# Altium project K_Cepelis_EKf-24.PrjPcb (part 6 of 6)
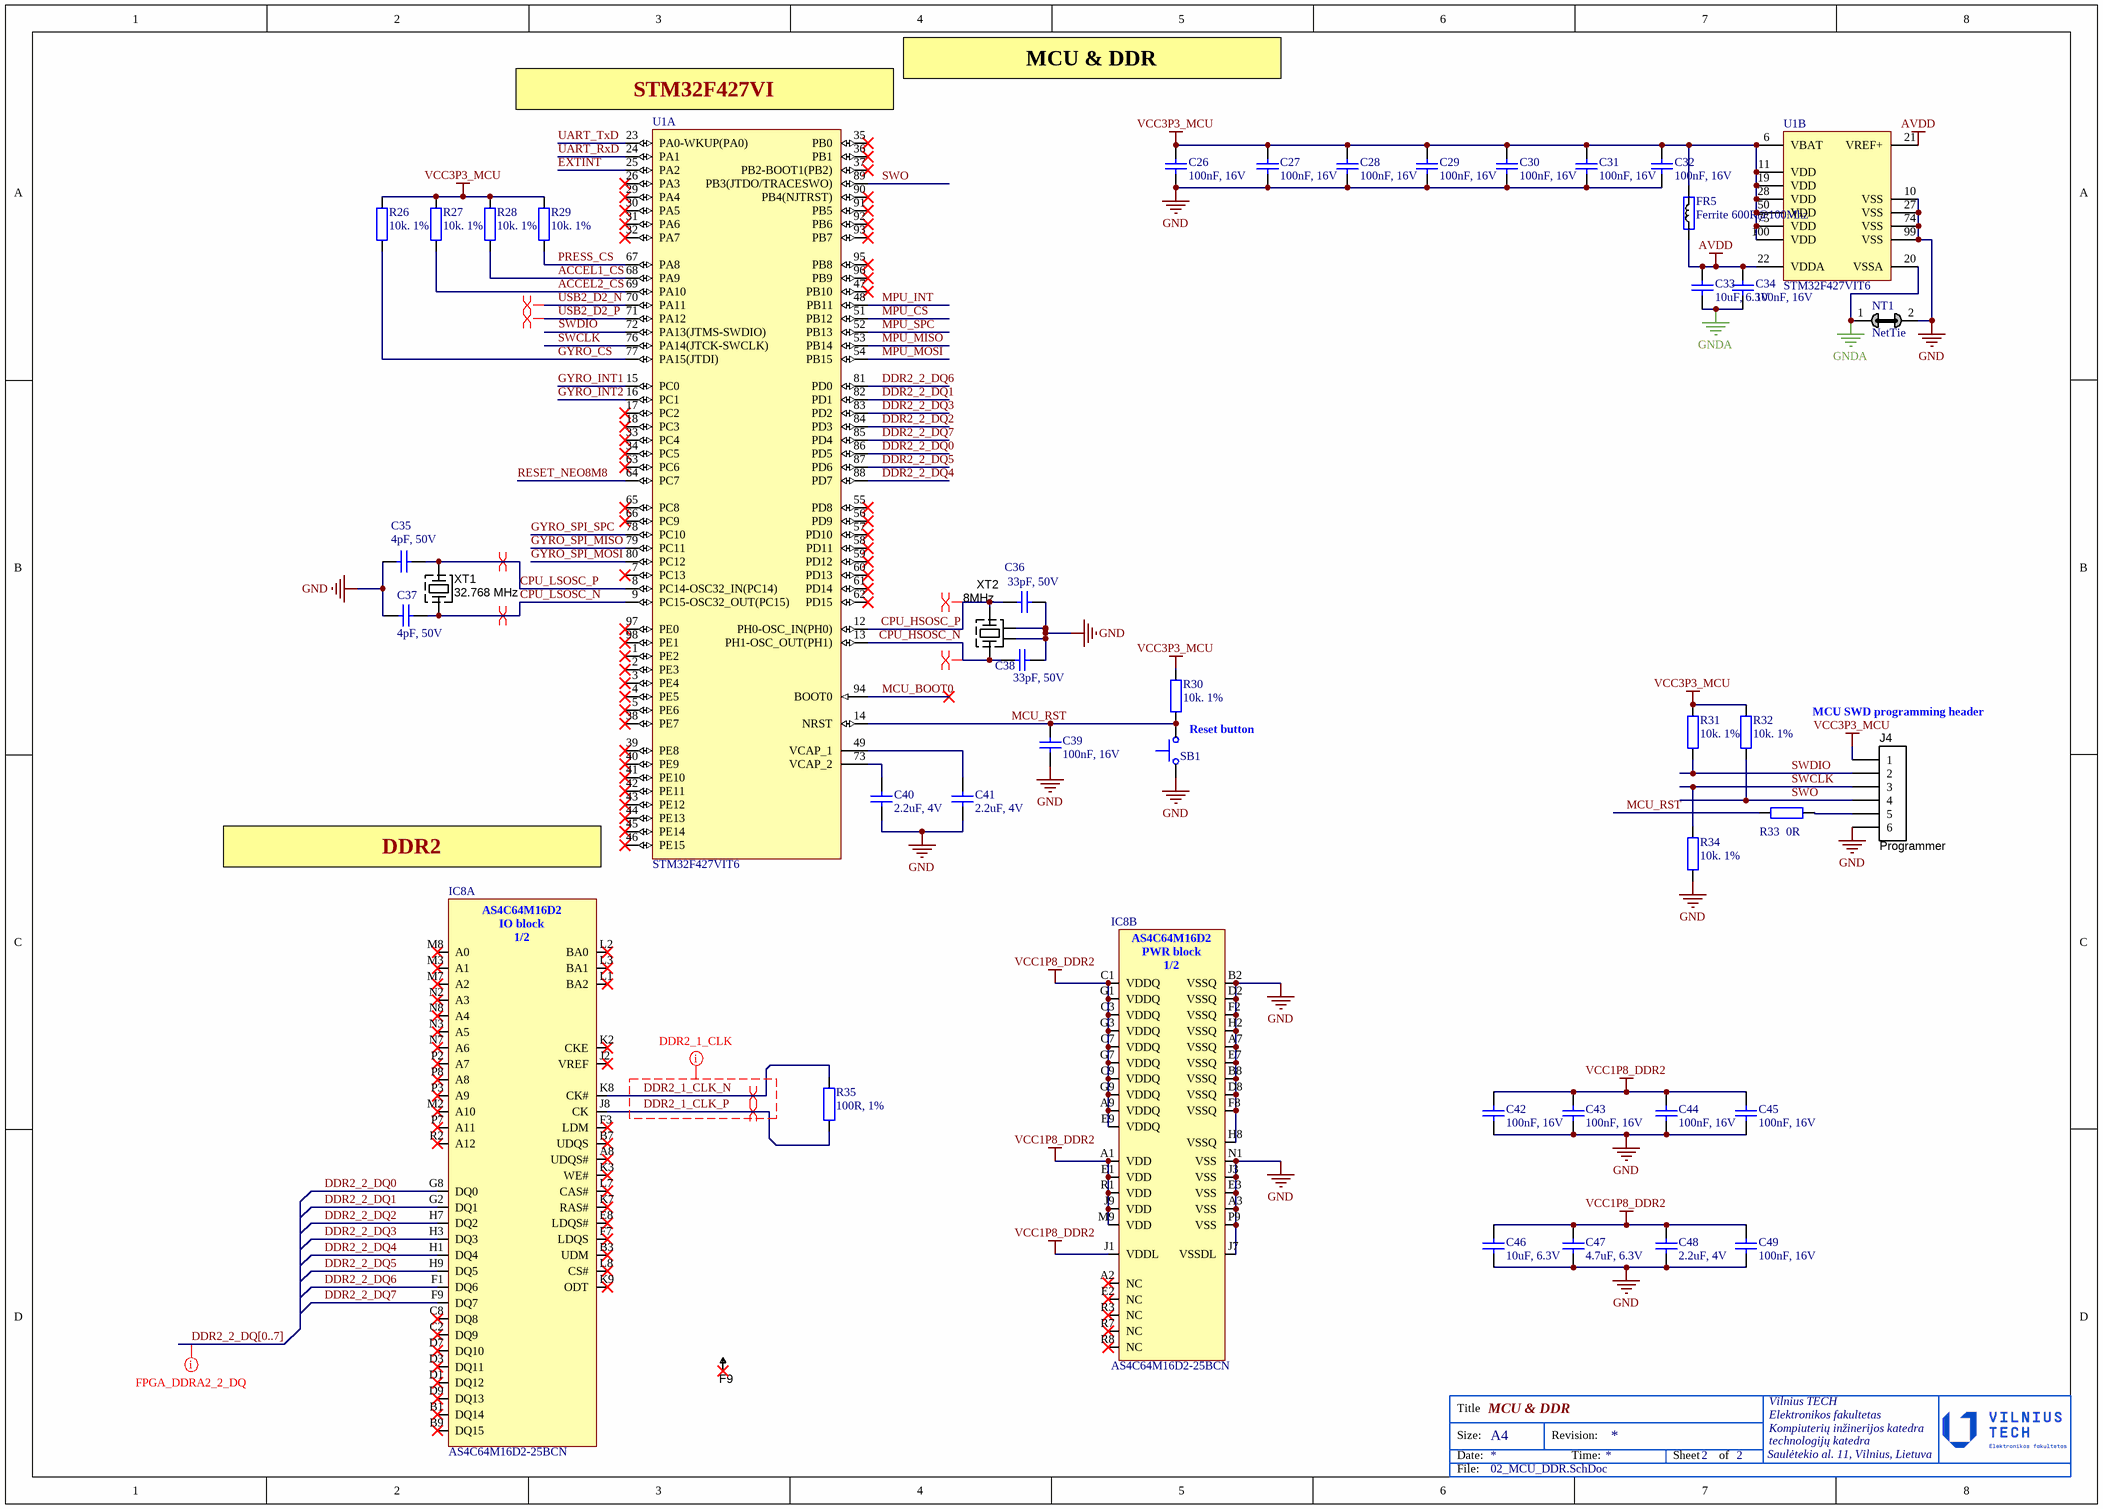
[diagram p6: 02_MCU_DDR.SchDoc]

## Sheet 02_MCU_DDR.SchDoc: MCU & DDR (continued)

### Library data of the parts (continued)
R35 = Res: Res Thick Film 0402 100 Ohm 1% 0.063W(1/16W) ±100ppm/C Pad SMD Automotive T/R; Manufacturer: Stackpole Electronics; Manufacturer Part Number: RMCF0402FT100R; Max Power Dissipation: 63mW; Temperature Coefficient: 100ppm/°C; Voltage Rating: 50V; Value: 100R, 1%; Supplier: Arrow Electronics; Supplier Part Number: RMCF0402FT100R; RoHS: Compliant; Category: Chip SMD Resistors; Stock: 280000; Pricing: 60000=0.0016 (USD); Case/Package: 0402; Case Code (Imperial): 0402; Case Code (Metric): 1005; China RoHS: Non-Compliant; Composition: Thick Film; Contact Plating: Tin; Country of Origin: Japan, Mainland China, Taiwan; Depth: 500µm; Export Control Classification Number (ECCN) Code: EAR99; Features: Automotive AEC-Q200; Height: 300µm; Harmonized Tariff Schedule (HTS) Code: 8533.21.00.30; Introduction Date: 2011-01-07; Lead Free: Lead Free; Length: 1mm; Lifecycle Status: Production; Max Operating Temperature: 155°C; Military Standard: Not; Min Operating Temperature: -55°C; Mounting Technology: Surface Mount; Number of Terminals: 2; Number of Terminations: 2; Packaging: Cut Tape (CT); Power Rating: 63mW; Ratings: AEC-Q200; REACH SVHC: Yes; Schedule B: 8533210045, 8533210045|8533210045, 8533210045|8533210045|8533210045, 8533210045|8533210045|8533210045|8533210045; Tolerance: 1%; Width: 500µm; Working Voltage: 50V; ComponentLink1URL: https://datasheet.octopart.com:443/RMCF0402FT100R-Stackpole-Electronics-datasheet-182148065.pdf?src-supplier=IHS; ComponentLink1Description: https://datasheet.octopart.com:443/RMCF0402FT100R-Stackpole-Electronics-datasheet-182148065.pdf?src-supplier=IHS; ComponentLink2URL: https://datasheet.octopart.com:443/RMCF0402FT100R-Stackpole-Electronics-datasheet-141193804.pdf?src-supplier=Upverter; ComponentLink2Description: https://datasheet.octopart.com:443/RMCF0402FT100R-Stackpole-Electronics-datasheet-141193804.pdf?src-supplier=Upverter; ComponentLink3URL: https://datasheet.octopart.com:443/RMCF0402FT100R-Stackpole-Electronics-datasheet-62091608.pdf?src-supplier=Upverter; ComponentLink3Description: https://datasheet.octopart.com:443/RMCF0402FT100R-Stackpole-Electronics-datasheet-62091608.pdf?src-supplier=Upverter; ComponentLink4URL: https://datasheet.octopart.com:443/RMCF0402FT100R-Stackpole-Electronics-datasheet-28504820.pdf?src-supplier=Upverter; ComponentLink4Description: https://datasheet.octopart.com:443/RMCF0402FT100R-Stackpole-Electronics-datasheet-28504820.pdf?src-supplier=Upverter; ComponentLink5URL: https://datasheet.octopart.com:443/RMCF0402FT100R-Stackpole-Electronics-datasheet-12534581.pdf?src-supplier=Stackpole+Electronics; ComponentLink5Description: https://datasheet.octopart.com:443/RMCF0402FT100R-Stackpole-Electronics-datasheet-12534581.pdf?src-supplier=Stackpole+Electronics; ComponentLink6URL: https://datasheet.octopart.com:443/RMCF0402FT100R-Stackpole-Electronics-datasheet-10788263.pdf?src-supplier=Stackpole+Electronics; ComponentLink6Description: https://datasheet.octopart.com:443/RMCF0402FT100R-Stackpole-Electronics-datasheet-10788263.pdf?src-supplier=Stackpole+Electronics; ComponentLink7URL: https://datasheet.octopart.com:443/RMCF0402FT100R-Stackpole-Electronics-datasheet-155966809.pdf?src-supplier=Electro+Sonic; ComponentLink7Description: https://datasheet.octopart.com:443/RMCF0402FT100R-Stackpole-Electronics-datasheet-155966809.pdf?src-supplier=Electro+Sonic; ComponentLink8URL: https://datasheet.octopart.com:443/RMCF0402FT100R-Stackpole-Electronics-datasheet-189104164.pdf?src-supplier=Master+Electronics; ComponentLink8Description: https://datasheet.octopart.com:443/RMCF0402FT100R-Stackpole-Electronics-datasheet-189104164.pdf?src-supplier=Master+Electronics; ComponentLink9URL: https://datasheet.octopart.com:443/RMCF0402FT100R-Stackpole-Electronics-datasheet-154799224.pdf?src-supplier=Master+Electronics; ComponentLink9Description: https://datasheet.octopart.com:443/RMCF0402FT100R-Stackpole-Electronics-datasheet-154799224.pdf?src-supplier=Master+Electronics; ComponentLink10URL: https://datasheet.octopart.com:443/RMCF0402FT100R-Stackpole-Electronics-datasheet-11547379.pdf?src-supplier=Arrow+Electronics; ComponentLink10Description: https://datasheet.octopart.com:443/RMCF0402FT100R-Stackpole-Electronics-datasheet-11547379.pdf?src-supplier=Arrow+Electronics; ComponentLink11URL: http://sigma.octopart.com:80/15940719/materials_sheet/Stackpole-Electronics-RMCF0402FT100R.pdf?src-supplier=Compliance+Statements; ComponentLink11Description: http://sigma.octopart.com:80/15940719/materials_sheet/Stackpole-Electronics-RMCF0402FT100R.pdf?src-supplier=Compliance+Statements; ComponentLink12URL: http://sigma.octopart.com:80/141158212/rohs_statement/Stackpole-Electronics-RMCF0402FT100R.pdf?src-supplier=Compliance+Statements; ComponentLink12Description: http://sigma.octopart.com:80/141158212/rohs_statement/Stackpole-Electronics-RMCF0402FT100R.pdf?src-supplier=Compliance+Statements; ComponentLink13URL: http://sigma.octopart.com:80/141158211/reach_statement/Stackpole-Electronics-RMCF0402FT100R.pdf?src-supplier=Compliance+Statements; ComponentLink13Description: http://sigma.octopart.com:80/141158211/reach_statement/Stackpole-Electronics-RMCF0402FT100R.pdf?src-supplier=Compliance+Statements
SB1 = Button: Switch Tactile N.O. SPST Round Button Solder Tab 12VDC 200000Cycles 1.5N SMD Emboss T/R; Manufacturer: Omron; Manufacturer Part Number: B3U-1000P; Manufacturer Package Identifier: B3U-1000P(M); Actuator Length: 400µm; Contact Current Rating: 50mA; Contact Resistance: 100mΩ; Electrical Life: 200kcycles; Illumination Type: Illuminated, Non-Illuminated; Max Voltage Rating (DC): 12V; Number of Positions: 1; Operating Force: 1.99N; Ratings: Dust Proof, IP40; Sealable: DUST PROOF; Switch Function: Off-Mom; Switch Travel: 150µm; Supplier: DigiKey; Supplier Part Number: SW1020CT-ND; RoHS: Compliant; Category: Tactile Switches; Stock: 119444; Pricing: 1=1.17, 10=0.997, 25=0.9268, 100=0.8261, 250=0.76544, 500=0.72342, 1000=0.68504 (USD); Ambient Temperature Range High: 70°C; Color: Silver; Contact Material: Silver; Contact Plating: Silver; Current Rating: 50mA; Depth: 2.5mm; Height: 1.2mm; Insulation Resistance: 100MΩ; Lead Free: Lead Free; Length: 3mm; Life (Cycles): 200kcycles; Lifecycle Status: Production; Max Current Rating: 50mA; Max Operating Temperature: 70°C; Mechanical Life: 200kcycles; Min Operating Temperature: -25°C; Mounting Technology: Surface Mount; Pins: 2; Packaging: Tape and Reel; REACH SVHC: Yes; Termination: SMD/SMT; Throw Configuration: SPST; Voltage Rating (DC): 12V; Weight: 21.99923mg; Width: 2.5mm; ComponentLink1URL: https://datasheet.octopart.com:443/B3U-1000P-Omron-datasheet-62106914.pdf?src-supplier=IHS; ComponentLink1Description: https://datasheet.octopart.com:443/B3U-1000P-Omron-datasheet-62106914.pdf?src-supplier=IHS; ComponentLink2URL: https://datasheet.octopart.com:443/B3U-1000P-Omron-datasheet-10910421.pdf?src-supplier=RS+(Formerly+Allied+Electronics); ComponentLink2Description: https://datasheet.octopart.com:443/B3U-1000P-Omron-datasheet-10910421.pdf?src-supplier=RS+(Formerly+Allied+Electronics); ComponentLink3URL: https://datasheet.octopart.com:443/B3U-1000P-Omron-datasheet-5458533.pdf?src-supplier=Upverter; ComponentLink3Description: https://datasheet.octopart.com:443/B3U-1000P-Omron-datasheet-5458533.pdf?src-supplier=Upverter; ComponentLink4URL: https://datasheet.octopart.com:443/B3U-1000P-Omron-datasheet-11968313.pdf?src-supplier=SOS+electronic; ComponentLink4Description: https://datasheet.octopart.com:443/B3U-1000P-Omron-datasheet-11968313.pdf?src-supplier=SOS+electronic; ComponentLink5URL: https://datasheet.octopart.com:443/B3U-1000P-Omron-datasheet-110759174.pdf?src-supplier=Newark; ComponentLink5Description: https://datasheet.octopart.com:443/B3U-1000P-Omron-datasheet-110759174.pdf?src-supplier=Newark; ComponentLink6URL: https://datasheet.octopart.com:443/B3U-1000P-Omron-datasheet-506776.pdf?src-supplier=Newark; ComponentLink6Description: https://datasheet.octopart.com:443/B3U-1000P-Omron-datasheet-506776.pdf?src-supplier=Newark; ComponentLink7URL: https://datasheet.octopart.com:443/B3U-1000P-Omron-datasheet-17589256.pdf?src-supplier=TME; ComponentLink7Description: https://datasheet.octopart.com:443/B3U-1000P-Omron-datasheet-17589256.pdf?src-supplier=TME
U1 = STM32F427VIT6: ARM Cortex-M4 32-bit MCU+FPU, 210 DMIPS, 2048 kB Flash, 256 kB Internal RAM, 82 I/Os, 100-pin LQFP, -40 to 85 degC, Tray; Manufacturer: STMicroelectronics; D/A Converter: 2x12-bit; FLASH Size (Prog) (kB): 2048; I/Os (High Current): 82; Internal RAM Size (kB): 256; Operating Frequency(F) (Processor speed) (MHz): 168; Supply Voltage(Vcc) max (V): 3.6; Supply Voltage(Vcc) min (V): 1.8; DatasheetVersion: Rev. 1; PackageVersion: Rev. 1, 06/2013; PackageReference: LQFP100; PackageDescription: 100-Pin Low Profile Quad Flat Package, 14 x 14 mm Body, 0.5 mm Pitch; Supplier 1: Digi-Key; Supplier Part Number 1: 497-14049-ND; Supplier 2: Farnell; Supplier Part Number 2: 2333369; Supplier 3: Newark; Supplier Part Number 3: 99W9927; Supplier 4: Newark; Supplier Part Number 4: 66W7312; Supplier 5: Mouser; Supplier Part Number 5: 511-STM32F427VIT6; Core: ARM Cortex-M4; Packing: Tray; Mounting Technology: Surface Mount; PartNumber: STM32F427VIT6; ComponentLink1Description: Manufacturer URL; ComponentLink1URL: http://www.st.com/web/en/home.html; ComponentLink2Description: Datasheet; ComponentLink2URL: http://www.st.com/st-web-ui/static/active/en/resource/technical/document/datasheet/DM00071990.pdf; ComponentLink3Description: Package Specification; ComponentLink3URL: http://www.st.com/st-web-ui/static/active/en/resource/technical/document/data_brief/DM00071938.pdf
XT1 = CRYSTAL_v2: Crystal, 32.768Khz, 6Pf, 3.2Mm X 1.5Mm Rohs Compliant: Yes |Abracon ABS07-LR-32.768KHZ-6-T; Manufacturer: Abracon LLC; Operating Mode: Fundamental; ESR (Equivalent Series Resistance): 50 kOhm; Frequency Tolerance: ±20ppm; ESR: 50kΩ; Tolerance: 0.002%; Supplier 1: Digi-Key; Category: Crystals and Oscillators; Mounting Type: Surface Mount; Operating Temperature: -40°C ~ 85°C; Manufacturer Part Number 1: ABS07-LR-32.768KHZ-6-T; Load Capacitance: 6pF; Frequency Stability: -; Type: kHz Crystal (Tuning Fork); Size / Dimension: 0.126" L x 0.061" W (3.20mm x 1.50mm); Package / Case: 2-SMD; RoHS: RoHS Compliant; Ratings: -; Frequency: 32.768kHz; Height: 0.035" (0.90mm); Packaging: Cut Tape (CT); Supplier Part Number 1: 535-12942-1-ND; Supplier: DigiKey; Supplier Part Number: 535-12942-1-ND; Manufacturer Part Number: ABS07-LR-32.768KHZ-6-T; Stock: 176427; Pricing: 1=1.5, 10=1.303, 25=1.232, 50=1.1812, 100=1.1322, 250=1.07076, 500=1.02648, 1000=0.98405 (USD); Case/Package: SMD/SMT; China RoHS: Compliant; Harmonized Tariff Schedule (HTS) Code: 8541.60.00.10; Introduction Date: 2015-04-02; Length: 3.2004mm; Lifecycle Status: Production; Max Operating Temperature: 85°C; Min Operating Temperature: -40°C; Mounting Technology: Surface Mount; REACH SVHC: Yes; Schedule B: 8541600025, 8541600025|8541600025|8541600025|8541600025|8541600025, 8541600080; Width: 1.5494mm; ComponentLink1URL: https://datasheet.octopart.com:443/ABS07-LR-32.768KHZ-6-T-Abracon-datasheet-182205061.pdf?src-supplier=Master+Electronics; ComponentLink1Description: https://datasheet.octopart.com:443/ABS07-LR-32.768KHZ-6-T-Abracon-datasheet-182205061.pdf?src-supplier=Master+Electronics; ComponentLink2URL: https://datasheet.octopart.com:443/ABS07-LR-32.768KHZ-6-T-Abracon-datasheet-65748761.pdf?src-supplier=element14+APAC; ComponentLink2Description: https://datasheet.octopart.com:443/ABS07-LR-32.768KHZ-6-T-Abracon-datasheet-65748761.pdf?src-supplier=element14+APAC; ComponentLink3URL: https://datasheet.octopart.com:443/ABS07-LR-32.768KHZ-6-T-Abracon-datasheet-103422647.pdf?src-supplier=Future+Electronics; ComponentLink3Description: https://datasheet.octopart.com:443/ABS07-LR-32.768KHZ-6-T-Abracon-datasheet-103422647.pdf?src-supplier=Future+Electronics; ComponentLink4URL: http://sigma.octopart.com:80/conflict_mineral_statement/Abracon-company-27.pdf?src-supplier=Compliance+Statements; ComponentLink4Description: http://sigma.octopart.com:80/conflict_mineral_statement/Abracon-company-27.pdf?src-supplier=Compliance+Statements
XT2 = CRYSTAL_19M2: Seam Seal Crystal Ceramic, 8.000Mhz, 18Pf, 20Ppm-20+70C, 50Ppm-20+70C Rohs Compliant: Yes; Manufacturer 1: TXC CORPORATION; Manufacturer Part Number 1: 7M-27.120MEEQ-T; Manufacturer: Abracon; Manufacturer Part Number: ABM3B-8.000MHZ-B2-T; Ratings: 4.9152 MHz Crystal; Frequency Stability: ±10ppm; Load Capacitance: 10pF; Operating Mode: Fundamental; ESR (Equivalent Series Resistance): 200Ω; Max Supply Voltage: 45V; Min Supply Voltage: 8.2V; Output Current: 1.8A; Output Voltage: 3.3V; Tolerance: 0.002%; Package / Case: 2.5mm pitch; Material: Ceramic; Supplier 1: Digi-Key; Supplier Part Number 1: 887-1329-1-ND; Type: MHz Crystal; Frequency Tolerance: ±10ppm; Operating Temperature: -20°C ~ 70°C; Mounting Type: Surface Mount; Size / Dimension: 0.126" L x 0.098" W (3.20mm x 2.50mm); ComponentLink1URL: http://www.txccrystal.com/images/pdf/7m-accuracy.pdf; ComponentLink1Description: http://www.txccrystal.com/images/pdf/7m-accuracy.pdf; Supplier: Arrow Electronics; Supplier Part Number: ABM3B-8.000MHZ-B2-T; RoHS: Compliant; Category: Crystals; Stock: 70000; Pricing: 1000=0.2318 (USD); Case/Package: CSMD; China RoHS: Compliant; Composition: Ceramic; Depth: 3.2mm; Frequency: 8MHz; Height: 1.1mm; Lead Free: Lead Free; Length: 5mm; Lifecycle Status: Production; Max Operating Temperature: 70°C; Min Operating Temperature: -20°C; Mounting Technology: Surface Mount; Pins: 4; Packaging: Rail/Tube; Radiation Hardening: No; REACH SVHC: Yes; Schedule B: 8541600025, 8541600025|8541600025|8541600025|8541600025|8541600025|8541600025|8541600025|8541600025|8541600025|8541600025|8541600025|8541600025|8541600025|8541600025|8541600025|8541600025|8541600025|8541600025|8541600025|8541600025|8541600025|8541600025|8541600025|85; ESR: 200Ω; Termination: SMD/SMT; Weight: 120.003531mg; Width: 3.2mm; ComponentLink2URL: https://datasheet.octopart.com:443/ABM3B-8.000MHZ-B2-T-Abracon-datasheet-103053453.pdf?src-supplier=IHS; ComponentLink2Description: https://datasheet.octopart.com:443/ABM3B-8.000MHZ-B2-T-Abracon-datasheet-103053453.pdf?src-supplier=IHS; ComponentLink3URL: https://datasheet.octopart.com:443/ABM3B-8.000MHZ-B2-T-Abracon-datasheet-12510201.pdf?src-supplier=Farnell; ComponentLink3Description: https://datasheet.octopart.com:443/ABM3B-8.000MHZ-B2-T-Abracon-datasheet-12510201.pdf?src-supplier=Farnell; ComponentLink4URL: https://datasheet.octopart.com:443/ABM3B-8.000MHZ-B2-T-Abracon-datasheet-10078707.pdf?src-supplier=Farnell; ComponentLink4Description: https://datasheet.octopart.com:443/ABM3B-8.000MHZ-B2-T-Abracon-datasheet-10078707.pdf?src-supplier=Farnell; ComponentLink5URL: https://datasheet.octopart.com:443/ABM3B-8.000MHZ-B2-T-Abracon-datasheet-8877207.pdf?src-supplier=Farnell; ComponentLink5Description: https://datasheet.octopart.com:443/ABM3B-8.000MHZ-B2-T-Abracon-datasheet-8877207.pdf?src-supplier=Farnell; ComponentLink6URL: https://datasheet.octopart.com:443/ABM3B-8.000MHZ-B2-T-Abracon-datasheet-8791629.pdf?src-supplier=Farnell; ComponentLink6Description: https://datasheet.octopart.com:443/ABM3B-8.000MHZ-B2-T-Abracon-datasheet-8791629.pdf?src-supplier=Farnell; ComponentLink7URL: https://datasheet.octopart.com:443/ABM3B-8.000MHZ-B2-T-Abracon-datasheet-8450969.pdf?src-supplier=Farnell; ComponentLink7Description: https://datasheet.octopart.com:443/ABM3B-8.000MHZ-B2-T-Abracon-datasheet-8450969.pdf?src-supplier=Farnell; ComponentLink8URL: https://datasheet.octopart.com:443/ABM3B-8.000MHZ-B2-T-Abracon-datasheet-5300259.pdf?src-supplier=Farnell; ComponentLink8Description: https://datasheet.octopart.com:443/ABM3B-8.000MHZ-B2-T-Abracon-datasheet-5300259.pdf?src-supplier=Farnell; ComponentLink9URL: https://datasheet.octopart.com:443/ABM3B-8.000MHZ-B2-T-Abracon-datasheet-189095940.pdf?src-supplier=JRH+Electronics; ComponentLink9Description: https://datasheet.octopart.com:443/ABM3B-8.000MHZ-B2-T-Abracon-datasheet-189095940.pdf?src-supplier=JRH+Electronics; ComponentLink10URL: https://datasheet.octopart.com:443/ABM3B-8.000MHZ-B2-T-Abracon-datasheet-28516014.pdf?src-supplier=element14+APAC; ComponentLink10Description: https://datasheet.octopart.com:443/ABM3B-8.000MHZ-B2-T-Abracon-datasheet-28516014.pdf?src-supplier=element14+APAC; ComponentLink11URL: https://datasheet.octopart.com:443/ABM3B-8.000MHZ-B2-T-Abracon-datasheet-128558738.pdf?src-supplier=X-ON; ComponentLink11Description: https://datasheet.octopart.com:443/ABM3B-8.000MHZ-B2-T-Abracon-datasheet-128558738.pdf?src-supplier=X-ON; ComponentLink12URL: https://sigma.octopart.com:443/141159864/technical_drawing/Abracon-ABM3B-8.000MHZ-B2-T.pdf?src-supplier=Abracon+SCT; ComponentLink12Description: https://sigma.octopart.com:443/141159864/technical_drawing/Abracon-ABM3B-8.000MHZ-B2-T.pdf?src-supplier=Abracon+SCT; ComponentLink13URL: https://datasheet.octopart.com:443/ABM3B-8.000MHZ-B2-T-Abracon-datasheet-20679160.pdf?src-supplier=TME; ComponentLink13Description: https://datasheet.octopart.com:443/ABM3B-8.000MHZ-B2-T-Abracon-datasheet-20679160.pdf?src-supplier=TME; ComponentLink14URL: http://sigma.octopart.com:80/conflict_mineral_statement/Abracon-company-27.pdf?src-supplier=Compliance+Statements; ComponentLink14Description: http://sigma.octopart.com:80/conflict_mineral_statement/Abracon-company-27.pdf?src-supplier=Compliance+Statements

## Nets that join several sheets
GND: 01_Power_RF (59 pins), 02_MCU_DDR (48 pins)
VCC1P8_DDR2: 01_Power_RF (R7.2), 02_MCU_DDR (24 pins)
VCC3P3_MCU: 01_Power_RF (12 pins), 02_MCU_DDR (23 pins)
EXTINT: 01_Power_RF (IC5.4), 02_MCU_DDR (U1.25)
GYRO_CS: 01_Power_RF (IC6.5), 02_MCU_DDR (R26.1 U1.77)
GYRO_INT1: 01_Power_RF (IC6.7), 02_MCU_DDR (U1.15)
GYRO_INT2: 01_Power_RF (IC6.6), 02_MCU_DDR (U1.16)
GYRO_SPI_MISO: 01_Power_RF (IC6.4), 02_MCU_DDR (U1.79)
GYRO_SPI_MOSI: 01_Power_RF (IC6.3), 02_MCU_DDR (U1.80)
GYRO_SPI_SPC: 01_Power_RF (IC6.2), 02_MCU_DDR (U1.78)
MPU_CS: 01_Power_RF (IC7.22 R20.1), 02_MCU_DDR (U1.51)
MPU_INT: 01_Power_RF (IC7.12), 02_MCU_DDR (U1.48)
MPU_MISO: 01_Power_RF (IC7.9), 02_MCU_DDR (U1.53)
MPU_MOSI: 01_Power_RF (IC7.24), 02_MCU_DDR (U1.54)
MPU_SPC: 01_Power_RF (IC7.23), 02_MCU_DDR (U1.52)
RESET_NEO8M8: 01_Power_RF (IC5.8 R21.1 R24.2), 02_MCU_DDR (U1.64)
UART_RxD: 01_Power_RF (IC5.20), 02_MCU_DDR (U1.24)
UART_TxD: 01_Power_RF (IC5.21), 02_MCU_DDR (U1.23)
USB2_D2_N: 01_Power_RF (R5.2), 02_MCU_DDR (U1.70)
USB2_D2_P: 01_Power_RF (R8.2), 02_MCU_DDR (U1.71)